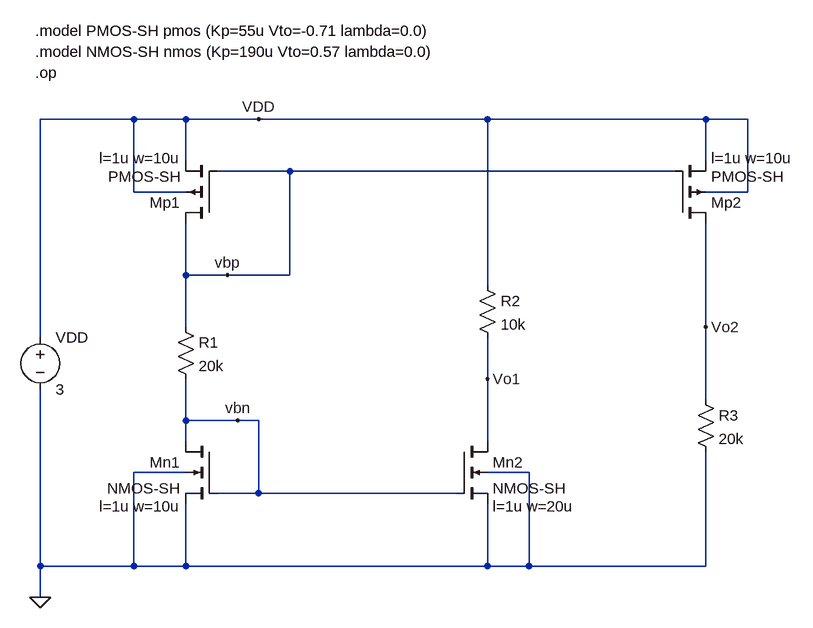
[diagram p0: schematic 1_bias1.asc]
1_bias1.asc, the LTspice schematic file:
Version 4
SHEET 1 1092 692
WIRE -1056 -64 -1200 -64
WIRE -976 -64 -1056 -64
WIRE -864 -64 -976 -64
WIRE -512 -64 -864 -64
WIRE -176 -64 -512 -64
WIRE -112 -64 -176 -64
WIRE -976 0 -976 -64
WIRE -176 0 -176 -64
WIRE -816 16 -928 16
WIRE -224 16 -816 16
WIRE -1056 48 -1056 -64
WIRE -976 48 -1056 48
WIRE -112 48 -112 -64
WIRE -112 48 -176 48
WIRE -976 176 -976 96
WIRE -912 176 -976 176
WIRE -816 176 -816 16
WIRE -816 176 -912 176
WIRE -512 192 -512 -64
WIRE -976 256 -976 176
WIRE -176 256 -176 96
WIRE -1200 272 -1200 -64
WIRE -512 336 -512 272
WIRE -176 368 -176 256
WIRE -976 400 -976 336
WIRE -896 400 -976 400
WIRE -864 400 -896 400
WIRE -976 432 -976 400
WIRE -512 432 -512 336
WIRE -976 480 -1056 480
WIRE -448 480 -512 480
WIRE -864 512 -864 400
WIRE -864 512 -928 512
WIRE -560 512 -864 512
WIRE -1200 624 -1200 352
WIRE -1056 624 -1056 480
WIRE -1056 624 -1200 624
WIRE -976 624 -976 528
WIRE -976 624 -1056 624
WIRE -512 624 -512 528
WIRE -512 624 -976 624
WIRE -448 624 -448 480
WIRE -448 624 -512 624
WIRE -176 624 -176 448
WIRE -176 624 -448 624
WIRE -1200 672 -1200 624
FLAG -1200 672 0
FLAG -864 -64 VDD
FLAG -896 400 vbn
FLAG -912 176 vbp
FLAG -512 336 Vo1
FLAG -176 256 Vo2
SYMBOL nmos4 -560 432 R0
WINDOW 123 56 100 Left 2
SYMATTR Value2 l=1u w=20u
SYMATTR InstName Mn2
SYMATTR Value NMOS-SH
SYMBOL pmos4 -224 96 M180
WINDOW 123 56 100 Left 2
SYMATTR Value2 l=1u w=10u
SYMATTR InstName Mp2
SYMATTR Value PMOS-SH
SYMBOL nmos4 -928 432 M0
WINDOW 123 56 100 Left 2
SYMATTR Value2 l=1u w=10u
SYMATTR InstName Mn1
SYMATTR Value NMOS-SH
SYMBOL res -992 240 R0
SYMATTR InstName R1
SYMATTR Value 20k
SYMBOL voltage -1200 256 R0
WINDOW 123 0 0 Left 2
WINDOW 39 0 0 Left 2
SYMATTR InstName VDD
SYMATTR Value 3
SYMBOL pmos4 -928 96 R180
WINDOW 123 56 100 Left 2
SYMATTR Value2 l=1u w=10u
SYMATTR InstName Mp1
SYMATTR Value PMOS-SH
SYMBOL res -528 176 R0
SYMATTR InstName R2
SYMATTR Value 10k
SYMBOL res -192 352 R0
SYMATTR InstName R3
SYMATTR Value 20k
TEXT -1208 -168 Left 2 !.model NMOS-SH nmos (Kp=190u Vto=0.57 lambda=0.0)
TEXT -1208 -136 Left 2 !.op
TEXT -1208 -200 Left 2 !.model PMOS-SH pmos (Kp=55u Vto=-0.71 lambda=0.0)

The netlist it stands for:
* 1_bias1.asc
Mn2 Vo1 vbn 0 0 NMOS-SH l=1u w=20u
Mp2 Vo2 vbp VDD VDD PMOS-SH l=1u w=10u
Mn1 vbn vbn 0 0 NMOS-SH l=1u w=10u
R1 vbp vbn 20k
VDD VDD 0 3
Mp1 vbp vbp VDD VDD PMOS-SH l=1u w=10u
R2 VDD Vo1 10k
R3 Vo2 0 20k
.model NMOS NMOS
.model PMOS PMOS
.lib standard.mos
.model NMOS-SH nmos (Kp=190u Vto=0.57 lambda=0.0)
.op
.model PMOS-SH pmos (Kp=55u Vto=-0.71 lambda=0.0)
.backanno
.end